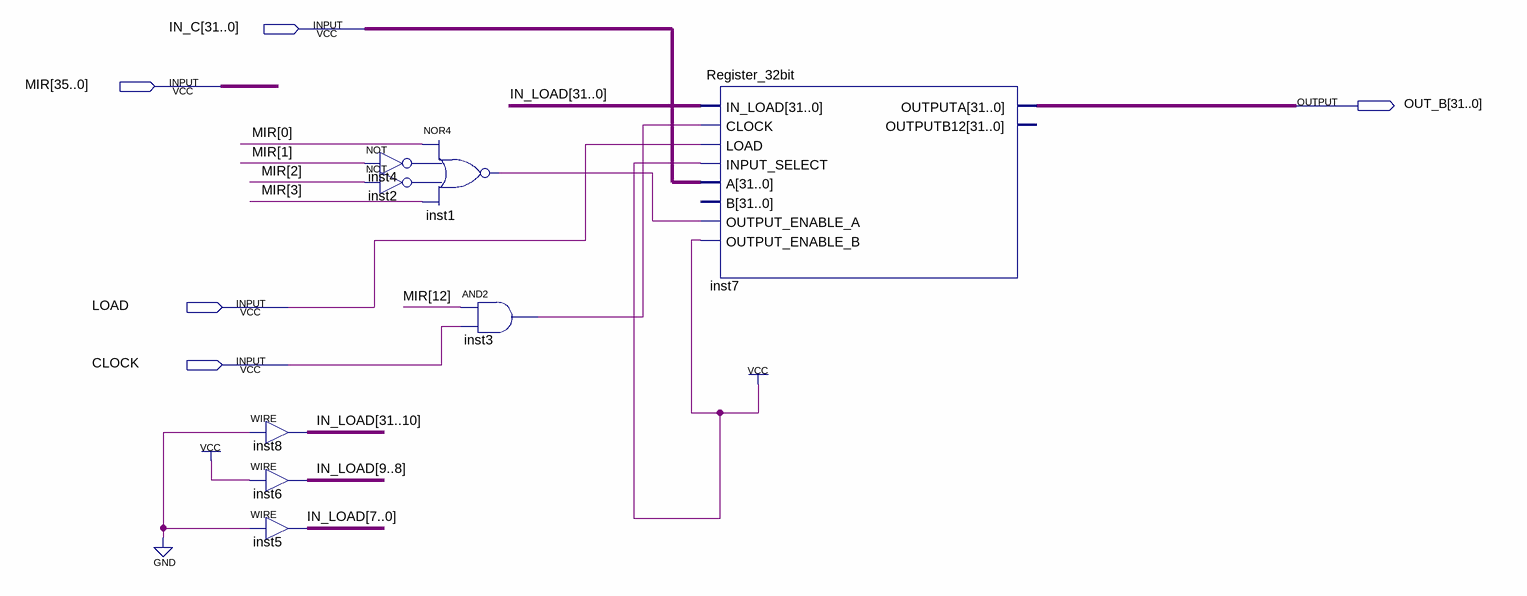
[diagram p0: schematic sheet]
// Quartus schematic CPP.bdf as structural Verilog: 8 symbols, 5 pins
module CPP (
  input  [31:0] IN_C,
  input  [35:0] MIR,
  input  LOAD,
  input  CLOCK,
  output [31:0] OUT_B
);

  wire inst1_out, inst2_out, inst3_out, inst4_out;
  wire [31:0] IN_LOAD;

  assign IN_LOAD[31:10] = {22{1'b0}};  // WIRE inst8
  assign IN_LOAD[9:8] = 2'b11;  // WIRE inst6
  assign IN_LOAD[7:0] = {8{1'b0}};  // WIRE inst5
  not inst4 (inst4_out, MIR[1]);
  not inst2 (inst2_out, MIR[2]);
  nor inst1 (inst1_out, MIR[0], inst4_out, inst2_out, MIR[3]);
  and inst3 (inst3_out, MIR[12], CLOCK);
  Register_32bit inst7 (
    .IN_LOAD(IN_LOAD), .CLOCK(inst3_out), .LOAD(LOAD), .INPUT_SELECT(1'b1), .A(IN_C),
    .OUTPUT_ENABLE_A(inst1_out), .OUTPUT_ENABLE_B(1'b1), .OUTPUTA(OUT_B));  // open: B, OUTPUTB12
endmodule
